# EAGLE design IR_FORWARD_V1 (EAGLE 9.6.2)
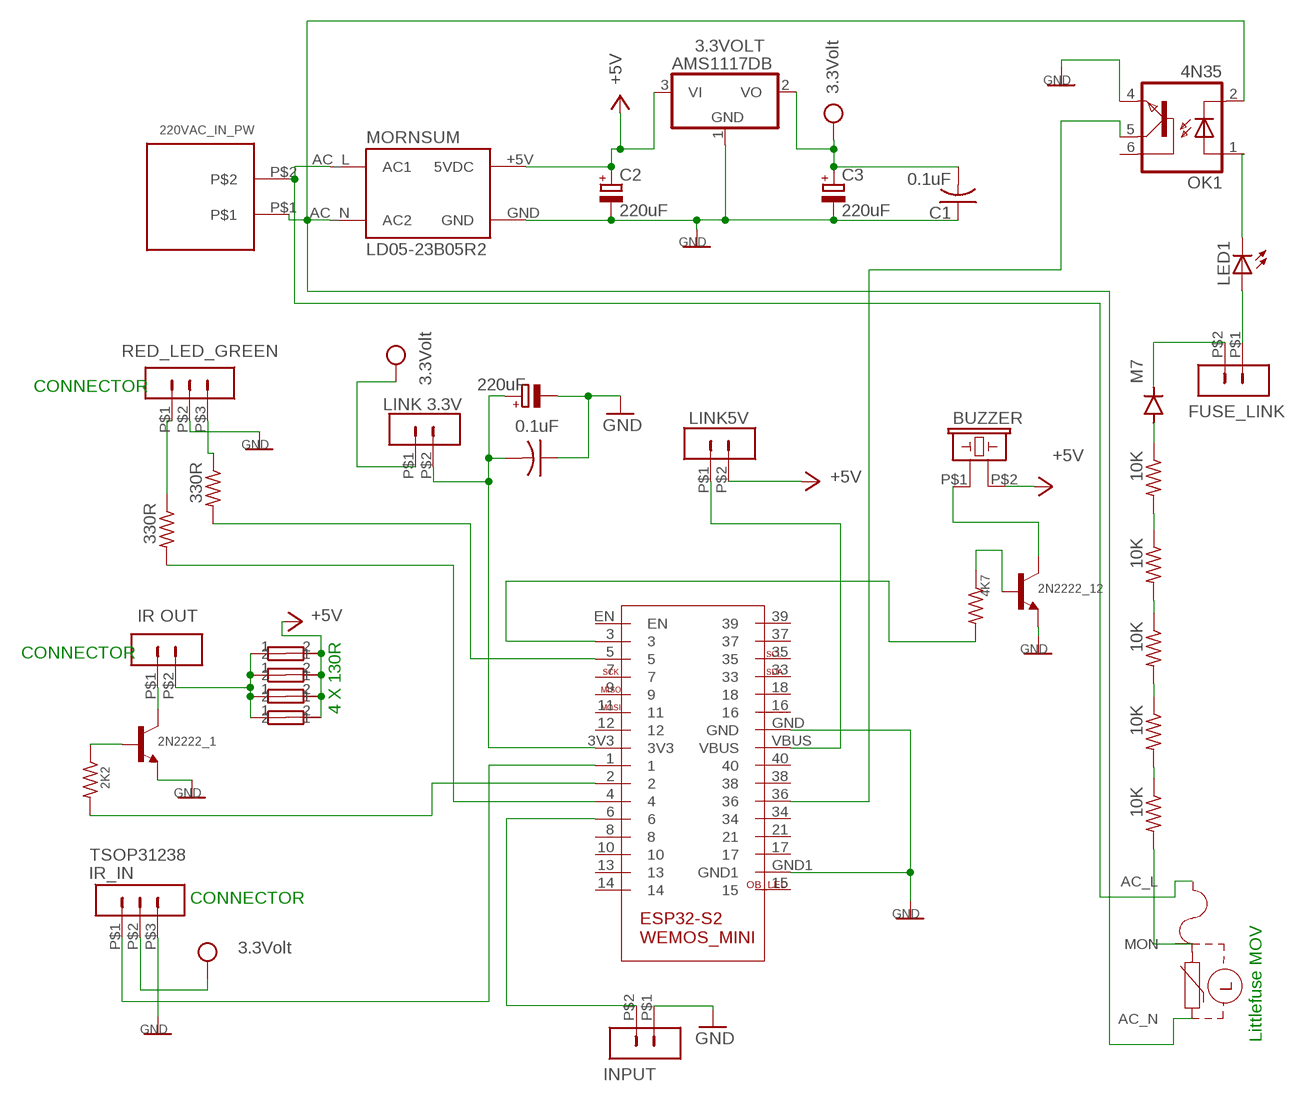
[diagram p0: schematic, sheet 1]

## Parts
2N2222_1  2N2222  2N3904  [TO92]
2N2222_12  2N2222  2N3904  [TO92]
3.3VOLT  AMS1117DB  [SOT223]
220VAC_SWITCH1  220VAC_IN_PW  TERMINAL-5.08MM-2DOUBLESIDE  [TERM-5.05-2]
BUZZER  BUZZERDONUT  [F/CM12P_2]
C1  0.1uF  C-US050-025X075  [C050-025X075]
C2  220uF  CPOL-EUE2.5-7  [E2,5-7]
C3  220uF  CPOL-EUE2.5-7  [E2,5-7]
C5  0.1uF  C-US050-025X075  [C050-025X075]
C6  220uF  CPOL-EUE2.5-7  [E2,5-7]
IR_IN  TSOP31238  3WAYHEADERSTRIPNARROW  [3WAY_SH_NARROW]
LED1  LEDCHIPLED_0805  [CHIPLED_0805]
LINK5V  LINK5V  2WAYHEADERSTRIP2WAYHP  [2WAYNORMAL]
M7-10  M7  DIODE-SOD106-R  [SOD106-R]
MORNSUM  MORNSUM_PSLONG  [LD05-23B05R2-M]
OK1  4N35  [DIL06]
R1  2K2  R-US_R0805  [R0805]
R2  330R  R-US_R0805  [R0805]
R5  330R  R-US_R0805  [R0805]
R10  10K  R-US_R1206  [R1206]
R11  10K  R-US_R1206  [R1206]
R12  10K  R-US_R1206  [R1206]
R13  10K  R-US_R1206  [R1206]
R14  10K  R-US_R1206  [R1206]
R48  4K7  R-US_R0805  [R0805]
U$1  RED_LED_GREEN  3WAYHEADERSTRIPNARROW  [3WAY_SH_NARROW]
U$2  130R  RESISTOR  [0207/10]
U$3  130R  RESISTOR  [0207/10]
U$4  WEMOS_S2_MINI  [WEMOS_S2_MINI]
U$5  130R  RESISTOR  [0207/10]
U$6  INPUT  2WAYHEADERSTRIPNARROW  [2WAY_SH_NARROW]
U$7  130R  RESISTOR  [0207/10]
U$9  LITLE_FUSE  [LITLE_FUSE]
U$12  IR OUT  2WAYHEADERSTRIPNARROW  [2WAY_SH_NARROW]
U$15  LINK 3.3V  2WAYHEADERSTRIP2WAYHP  [2WAYNORMAL]
U$20  FUSE_LINK  2WAYHEADERSTRIP2WAYHP  [2WAYNORMAL]

## Nets
+5V [12V]: 3.3VOLT.3(VI) BUZZER.P$2 C2.+ LINK5V.P$2 MORNSUM.+5V(5VDC) U$2.2 U$3.2 U$5.2 U$7.2
GND [GND]: 2N2222_1.3(E) 2N2222_12.3(E) 3.3VOLT.1(GND) C1.1 C2.- C3.- C5.1 C6.- IR_IN.P$3 MORNSUM.GND OK1.4(EMI) U$1.P$2 U$4.GND U$4.GND1 U$6.P$1
N$1 [POWER]: LINK5V.P$1 U$4.VBUS
N$2: 2N2222_12.2(B) R48.1
N$3 [POWER]: U$2.1 U$3.1 U$5.1 U$7.1 U$12.P$2
N$4: R2.1 U$1.P$3
N$5: R2.2 U$4.5
N$7 [POWER]: 220VAC_SWITCH1.P$1 MORNSUM.AC_N(AC2) OK1.2(C) U$9.AC_N
N$8: R5.1 U$1.P$1
N$9 [POWER]: 220VAC_SWITCH1.P$2 MORNSUM.AC_L(AC1) U$9.AC_L
N$10: R11.2 R12.1
N$12: R5.2 U$4.4
N$27: U$4.6 U$6.P$2
N$32: 2N2222_1.2(B) R1.1
N$34 [3V]: C5.2 C6.+ U$4.3V3 U$15.P$2
N$36: R1.2 U$4.2
N$37 [POWER]: 2N2222_1.1(C) U$12.P$1
N$38: 2N2222_12.1(C) BUZZER.P$1
N$41: IR_IN.P$1 U$4.1
N$42: OK1.5(COL) U$4.36
N$43: LED1.C OK1.1(A)
N$52: R10.1 R14.2
N$53: R10.2 R11.1
N$54: R48.2 U$4.3
N$55: R12.2 R13.1
N$56: LED1.A U$20.P$1
N$57: M7-10.A R14.1
N$58: M7-10.C U$20.P$2
N$61: R13.2 U$9.MON
VCC [3V]: 3.3VOLT.2(VO) C1.2 C3.+ IR_IN.P$2 U$15.P$1
Unconnected: OK1.6(BAS) U$4.7 U$4.8 U$4.9 U$4.10 U$4.11 U$4.12 U$4.13 U$4.14 U$4.15 U$4.16 U$4.17 U$4.18 U$4.21 U$4.33 U$4.34 U$4.35 U$4.37 U$4.38 U$4.39 U$4.40 U$4.EN

## Notes on the sheet
- CONNECTOR
- CONNECTOR
- 4 X 130R
- CONNECTOR
- Littlefuse MOV

## Library data of the parts
2N2222_1 2N2222_12 = transistor:2N3904: NPN TRANSISTOR
3.3VOLT = BDV_01:AMS1117: 250 mA, 16V, Low Quiescent Current LDO Regulator Source: http://ww1.microchip.com/downloads/en/DeviceDoc/22049b.pdf
220VAC_SWITCH1 = BDV_01:TERMINAL-5.08MM-2: Terminal 5.08mm - 2
BUZZER = BDV_01:BUZZER
C1 C5 = adafruit:C-US: CAPACITOR, American symbol
C2 C3 C6 = resistor:CPOL-EU: POLARIZED CAPACITOR, European symbol
IR_IN U$1 = BDV_02:3WAYHEADERSTRIP: 3Way Connect
LED1 = adafruit:LED: LED OSRAM: - CHIPLED LG R971, LG N971, LY N971, LG Q971, LY Q971, LO R971, LY R971 LH N974, LH R974 LS Q976, LO Q976, LY Q976 LO Q996 - Hyper CHIPLED LW Q18S LB Q993, LB Q99A, LB R99A - SideLED LS A670, LO A670, LY A670, LG A670, LP A670 LB A673, LV A673, LT A673, LW A673 LH A674 LY A675 LS A676, LA A676, LO A676, LY A676, LW A676 LS A679, LY A679, LG A679 - Hyper Micro SIDELED® LS Y876, LA Y876, LO Y876, LY Y876 LT Y87S - SmartLED LW L88C, LW L88S LB L89C, LB L89S, LG L890 LS L89K, LO L89K, LY L89K LS L896, LA L896, LO L896, LY L896 - TOPLED LS T670, LO T670, LY T670, LG T670, LP T670 LSG T670, LSP T670, LSY T670, LOP T670, LYG T670 LG T671, LOG T671, LSG T671 LB T673, LV T673, LT T673, LW T673 LH T674 LS T676, LA T676, LO T676, LY T676, LB T676, LH T676, LSB T676, LW T676 LB T67C, LV T67C, LT T67C, LS T67K, LO T67K, LY T67K, LW E67C LS E67B, LA E67B, LO E67B, LY E67B, LB E67C, LV E67C, LT E67C LW T67C LS T679, LY T679, LG T679 LS T770, LO T770, LY T770, LG T770, LP T770 LB T773, LV T773, LT T773, LW T773 LH T774 LS E675, LA E675, LY E675, LS T675 LS T776, LA T776, LO T776, LY T776, LB T776 LHGB T686 LT T68C, LB T68C - Hyper Mini TOPLED® LB M676 - Mini TOPLED Santana® LG M470 LS M47K, LO M47K, LY M47K Source: http://www.osram.convergy.de/
LINK5V U$6 U$12 U$15 U$20 = BDV_02:2WAYHEADERSTRIP: Narrow
M7-10 = diode:DIODE-: DIODE
MORNSUM = BDV_02:MORNSUM_PS: Mornsum LD05-23B05R2
OK1 = BDV_02:4N35: MOTOROLA OPTO COUPLER; MF: FAIRCHILD SEMICONDUCTOR; MPN: 4N35; OC_FARNELL: 1328375; OC_NEWARK: 72K9946
R1 R2 R5 R48 = resistor:R-US_: RESISTOR, American symbol
R10-R14 = adafruit:R-US_: RESISTOR, American symbol
U$2 U$3 U$5 U$7 = BDV_02:RESISTOR
U$4 = BDV_02:WEMOS_S2_MINI: WEMOS_MINI
U$9 = BDV_02:LITLE_FUSE: Litle Fuse

## Net classes
0 default: width 0.5 mm, drill 0.305 mm, clearance 0.305 mm
1 POWER: width 1.2 mm, drill 0.305 mm, clearance 0.305 mm to class 0, clearance 0.305 mm
2 12V: width 1 mm, drill 0.305 mm, clearance 0.305 mm to class 0, clearance 0.305 mm to class 1, clearance 0.305 mm
3 ground: width 1 mm, drill 0.305 mm, clearance 0.305 mm to class 0, clearance 0.305 mm to class 1, clearance 0.305 mm to class 2, clearance 0.305 mm
4 3V: width 1 mm, drill 0.305 mm, clearance 0.305 mm to class 0, clearance 0.305 mm to class 1, clearance 0.305 mm to class 2, clearance 0.305 mm to class 3, clearance 0.305 mm
5 GND: width 1 mm, drill 0.305 mm, clearance 0.305 mm to class 0, clearance 0.305 mm to class 1, clearance 0.305 mm to class 2, clearance 0.305 mm to class 3, clearance 0.305 mm to class 4, clearance 0.305 mm
6 12mil: width 0.305 mm

## Board
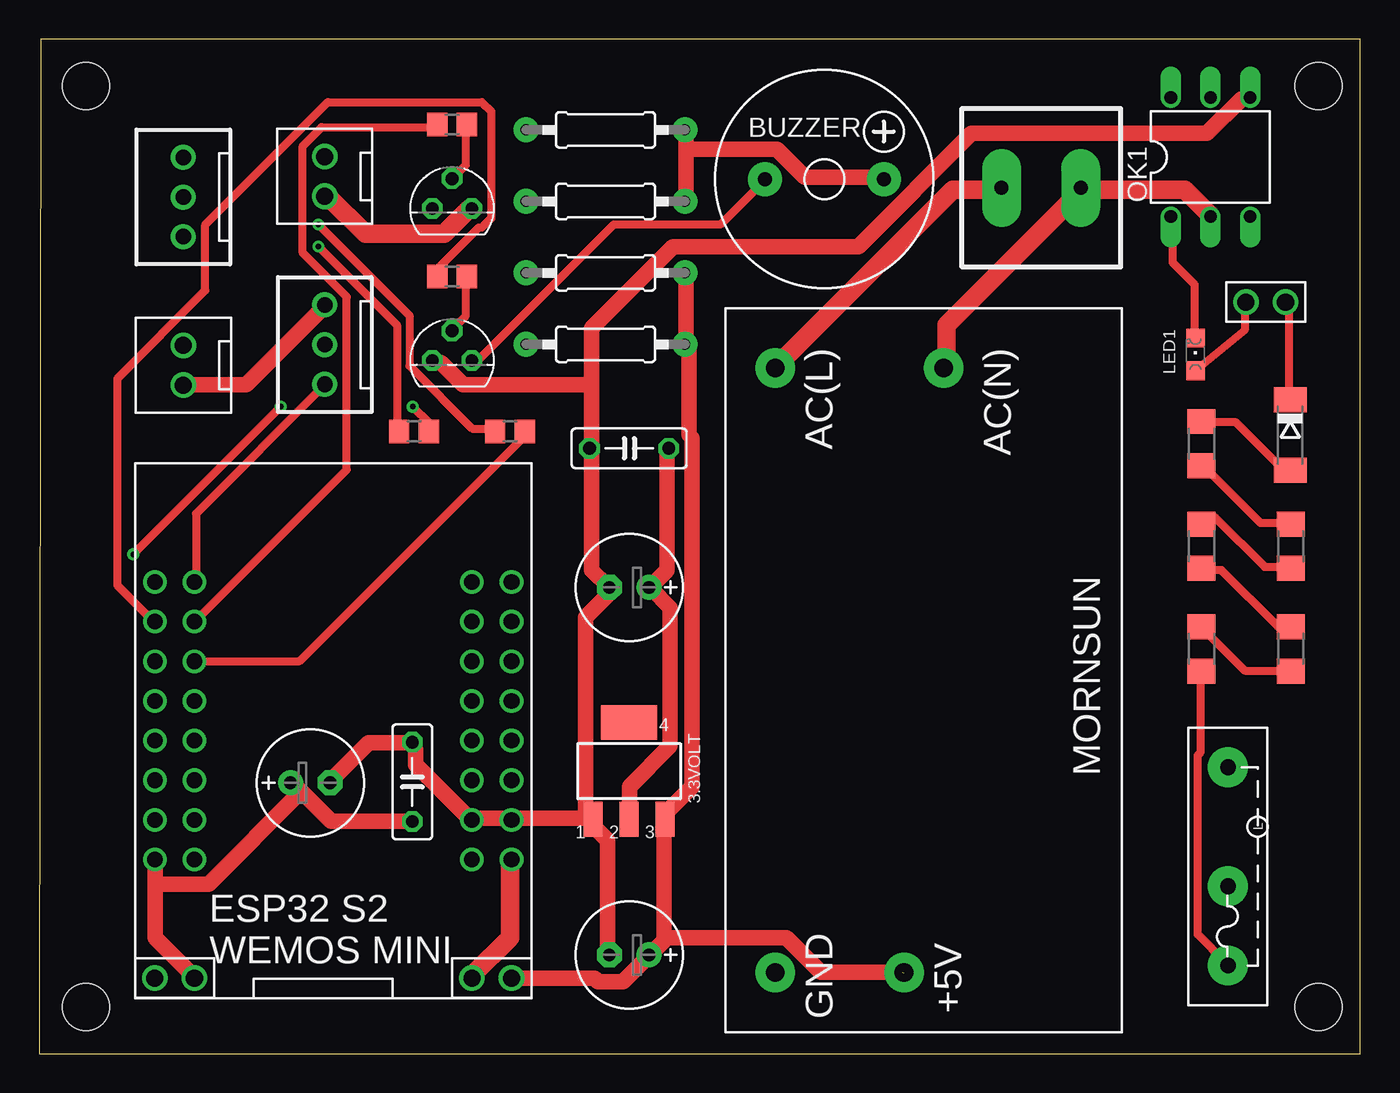
[diagram p1: board, top side]
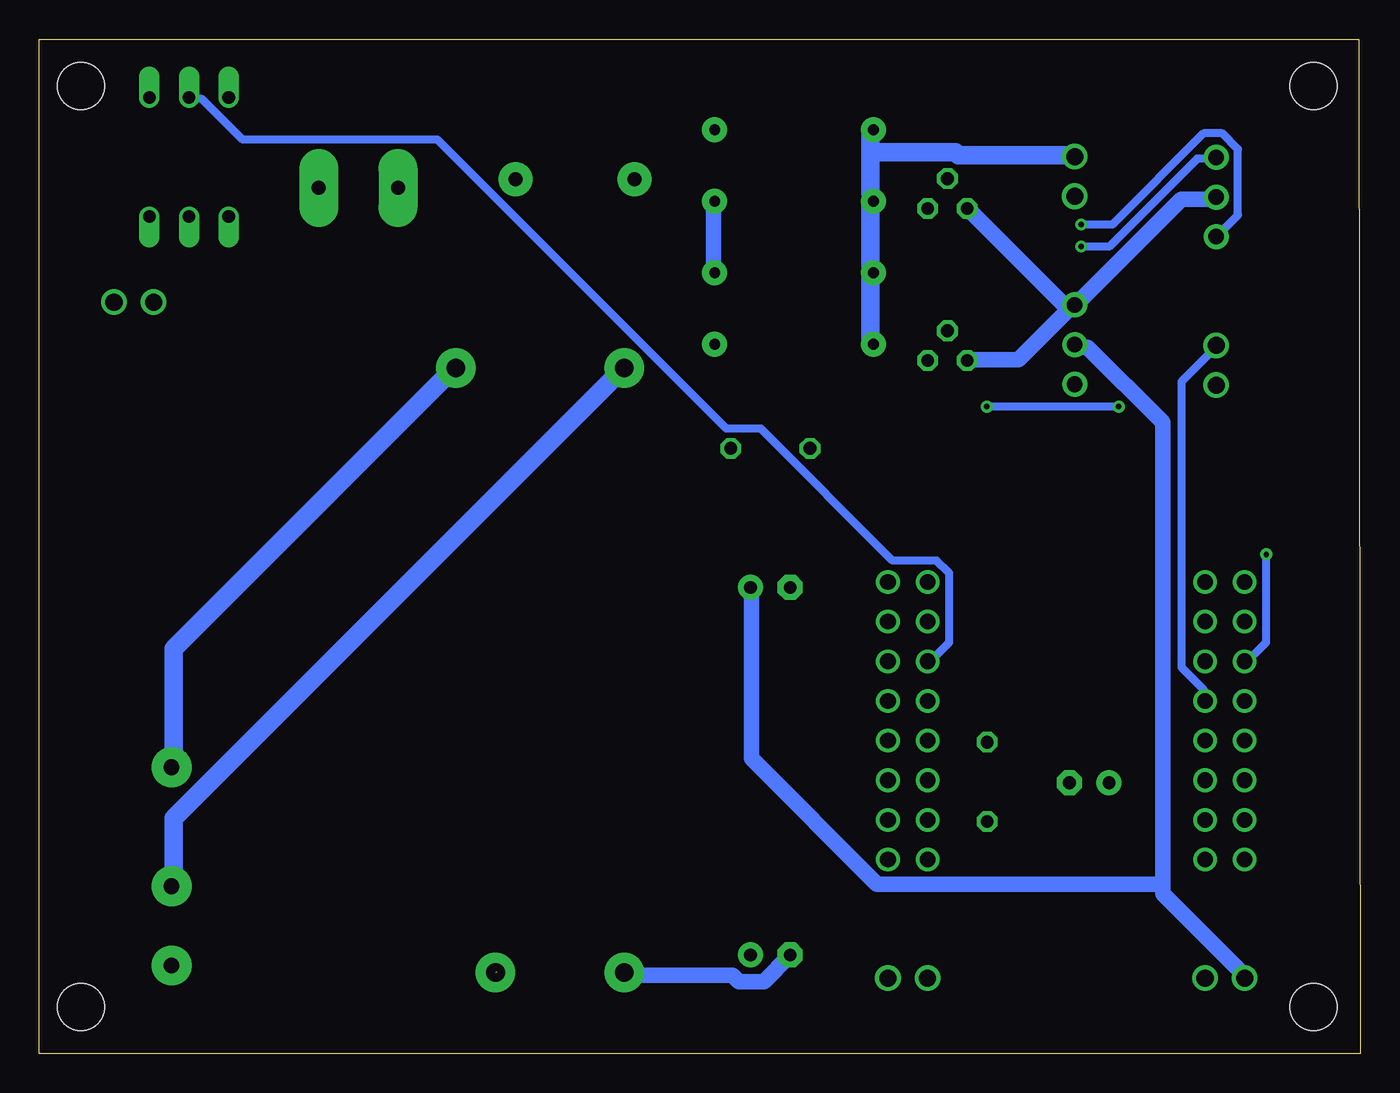
[diagram p2: board, bottom side, seen from below]

Size 84.68 x 65 mm. Coordinates in mm from the lower left corner, seen from the top.
Outline: 0,0 84.68,0 84.68,65 0.1,65 0,0
Copper layers (1*16): Top 0.035mm / dielectric 1.5mm / Bottom 0.035mm
Design rules "default *": minimum track width 6mil, minimum drill 0.35mm, track to track 6mil, track to pad 6mil, pad to pad 6mil, via to via 6mil, smd to smd 6mil, copper to edge 40mil, drill to drill 6mil, minimum pad ring 10mil, minimum via ring 8mil, stop-mask expansion 4mil, vias tented up to drill 20mil, thermal gap 10mil
Holes 3 mm at 3,62 3,3 82,3 82,62

### Footprints (pad centres in the part's own frame; a part is rotated, then mirrored left to right if it is on the bottom)
TO92 = drill 0.813 octagon: 1 1.27,0; 2 0,1.905; 3 -1.27,0
SOT223 = smd 1.219 x 2.235: 1 -2.311,-3.099; 2 0,-3.099; 3 2.311,-3.099 | smd 3.6 x 2.2: 4 0,3.099
TERM-5.05-2 = drill 0.9 pad 2.5 long: P$1 0,2.54; P$2 0,-2.54
F/CM12P_2 = drill 0.9 pad 2.184: P$1 -3.81,0; P$2 3.81,0
C050-025X075 = drill 0.813 octagon: 1 -2.54,0; 2 2.54,0
E2,5-7 = drill 0.813 pad 1.6: + -1.27,0 | drill 0.813 pad 1.6 octagon: - 1.27,0
3WAY_SH_NARROW = drill 1 pad 1.6: P$1 -6.35,0; P$2 -3.81,0; P$3 -1.27,0
CHIPLED_0805 = smd 1.2 x 1.2: A 0,-1.05; C 0,1.05
2WAYNORMAL = drill 1.092: P$1 -1.27,0; P$2 1.27,0
SOD106-R = smd 1.6 x 2.1: A 2.25,0; C -2.25,0
LD05-23B05R2-M = drill 1.2 pad 2.54: +5V 19.05,0; AC_L -19.685,-8.255; AC_N -19.685,2.54; GND 19.05,-8.255
DIL06 = drill 0.813 offset: 1 -2.54,-3.81; 2 0,-3.81; 3 2.54,-3.81; 4 2.54,3.81; 5 0,3.81; 6 -2.54,3.81
R0805 = smd 1.3 x 1.5: 1 -0.95,0; 2 0.95,0
R1206 = smd 1.6 x 1.803: 1 -1.422,0; 2 1.422,0
0207/10 = drill 0.7 pad 1.6: 1 -5.08,0; 2 5.08,0
WEMOS_S2_MINI = drill 1: 1 -8.89,10.16; 2 -8.89,7.62; 3 -11.43,7.62; 3V3 -11.43,-7.62; 4 -8.89,5.08; 5 -11.43,5.08; 6 -8.89,2.54; 7 -11.43,2.54; 8 -8.89,0; 9 -11.43,0; 10 -8.89,-2.54; 11 -11.43,-2.54; 12 -11.43,-5.08; 13 -8.89,-5.08; 14 -8.89,-7.62; 15 8.89,-7.62; 16 11.43,-2.54; 17 8.89,-2.54; 18 11.43,0; 21 8.89,0; 33 11.43,2.54; 34 8.89,2.54; 35 11.43,5.08; 36 8.89,5.08; 37 11.43,7.62; 38 8.89,7.62; 39 11.43,10.16; 40 8.89,10.16; EN -11.43,10.16; GND 11.43,-5.08; GND1 8.89,-5.08; VBUS 11.43,-7.62
2WAY_SH_NARROW = drill 1.092: P$1 -1.27,0; P$2 1.27,0
LITLE_FUSE = drill 1 pad 2.54: AC_L -1.27,0; AC_N 6.35,0; MON -6.35,0

### Placement (x,y rotation side)
2N2222_1  26.47,54.15 0 top
2N2222_12  26.47,44.4 0 top
3.3VOLT  37.81,18.11 0 top
220VAC_SWITCH1  64.22,55.47 270 top
BUZZER  50.33,56.02 0 top
C1  37.81,38.78 0 top
C2  37.81,6.33 180 top
C3  37.81,29.87 180 top
C5  23.92,17.42 270 top
C6  17.38,17.35 0 top
IR_IN  18.31,49.23 90 top
LED1  74.11,44.8 0 top
LINK5V  29.01,4.85 0 top
M7-10  80.17,39.63 270 top
MORNSUM  55.43,24.25 270 top
OK1  75.07,57.44 0 top
R1  26.47,59.53 180 top
R2  24.03,39.87 0 top
R5  30.18,39.87 0 top
R10  80.22,32.51 270 top
R11  74.49,32.51 270 top
R12  80.22,25.94 270 top
R13  74.49,25.94 270 top
R14  74.49,39.08 270 top
R48  26.47,49.78 180 top
U$1  9.25,58.69 90 top
U$2  36.3,59.18 0 top
U$3  36.3,54.6 0 top
U$4  18.85,20.06 0 top
U$5  36.3,50.02 0 top
U$6  9.25,44.1 90 top
U$7  36.3,45.44 0 top
U$9  76.18,12 90 top
U$12  18.31,56.2 90 top
U$15  8.69,4.85 0 top
U$20  78.61,48.15 0 top

### Tracks (layer width: path | path; a pad name or v marks a point on that pad's centre or on a via)
+5V  (1 unrouted)
  Top 1: U$5.2 41.45,49.9 41.45,45.47 U$7.2 41.65,45.07 41.65,39.64 41.85,39.44 41.85,17.1 40.24,15.49 3.3VOLT.3 40.04,14.89 40.04,7.44 | 41.45,57.95 41.45,59.15 U$2.2 | 41.45,57.95 41.45,54.73 U$3.2 | 41.45,57.95 47.28,57.95 49.09,56.13 54.12,56.13 BUZZER.P$2 | 40.04,7.44 40.04,7.24 39.23,6.44 C2.+ 38.83,6.04 37.42,4.63 35.81,4.63 35.61,4.83 30.38,4.83 LINK5V.P$2 | 55.33,5.23 50.1,5.23 47.89,7.44 40.04,7.44
  Bottom 1: U$5.2 41.45,50.1 41.45,54.52 U$3.2
GND
  Top 1: C6.- 18.71,17.5 21.13,19.92 23.74,19.92 C5.1 24.14,19.52 24.14,18.51 27.36,15.29 U$4.GND1 27.77,15.09 29.78,15.09 U$4.GND 30.38,15.09 35.41,15.09 3.3VOLT.1 | C2.- 36.42,6.44 36.42,13.68 35.41,14.69 3.3VOLT.1 | U$6.P$1 9.26,42.86 13.28,42.86 18.31,47.89 IR_IN.P$3 | 35.41,42.86 35.41,39.23 C1.1 35.41,38.63 35.41,30.98 36.42,29.98 C3.- 36.42,29.38 35.01,27.97 35.01,15.49 3.3VOLT.1 | 35.41,42.86 35.41,46.48 40.64,51.71 52.51,51.71 59.76,58.95 74.85,58.95 77.06,61.16 77.46,61.16 OK1.4 | 35.41,42.86 27.16,42.86 25.75,44.26 25.35,44.26 2N2222_12.3
  Bottom 1: MORNSUM.GND 47.08,5.03 40.24,5.03 39.84,4.63 38.23,4.63 36.62,6.24 C2.- | 2N2222_12.3 25.15,44.47 21.93,44.47 18.51,47.89 IR_IN.P$3 | 2N2222_1.3 25.15,54.12 18.91,47.89 IR_IN.P$3 | U$1.P$2 9.26,54.73 11.47,54.73 17.91,48.29 IR_IN.P$3
N$1
  Top 1.2: U$4.VBUS 30.18,12.27 30.18,7.44 27.77,5.03 LINK5V.P$1
N$2
  Top 0.5: R48.1 27.36,49.7 27.36,47.28 26.56,46.48 2N2222_12.2
N$3
  Bottom 1.2: U$7.1 31.39,45.47 31.39,49.9 U$5.1 31.39,50.5 31.39,54.52 U$3.1 31.39,55.13 31.39,57.74 | 31.39,57.74 31.39,59.15 U$2.1 | 31.39,57.74 25.95,57.74 25.75,57.54 18.51,57.54 U$12.P$2
N$4  (via drill 0.35)
  Top 0.5: v17.91,51.71 22.94,46.68 22.94,40.04 R2.1
  Bottom 0.5: v17.91,51.71 16.1,51.71 10.46,57.34 9.26,57.34 U$1.P$3
N$5  (via drill 0.35)
  Top 0.5: v23.94,41.45 24.95,40.44 24.95,40.04 R2.2 | v6.04,31.99 v15.49,41.45
  Bottom 0.5: v15.49,41.45 v23.94,41.45 | v6.04,31.99 6.04,26.36 7.24,25.15 U$4.5
N$7
  Top 1.2: OK1.2 75.05,53.72 73.44,55.33 66.8,55.33 220VAC_SWITCH1.P$1 66.4,54.93 58.15,46.68 58.15,44.06 MORNSUM.AC_N
  Bottom 1.2: U$9.AC_N 76.05,18.51 76.05,25.95 58.15,43.86 MORNSUM.AC_N
N$8  (via drill 0.35)
  Top 0.5: v17.91,53.12 23.74,47.28 23.74,44.06 27.77,40.04 29.17,40.04 R5.1
  Bottom 0.5: v17.91,53.12 15.89,53.12 10.06,58.95 8.85,58.95 7.85,57.95 7.85,53.72 9.05,52.51 U$1.P$1
N$9
  Top 1.2: 220VAC_SWITCH1.P$2 61.57,55.33 58.55,55.33 47.28,44.06 MORNSUM.AC_L
  Bottom 1.2: U$9.AC_L 76.05,10.87 76.05,15.09 47.28,43.86 MORNSUM.AC_L
N$10
  Top 0.5: R11.2 74.64,30.98 75.77,30.98 79.37,27.38 R12.1
N$12
  Top 0.5: R5.2 30.98,39.84 30.98,39.44 16.7,25.15 10.06,25.15 U$4.4
N$27
  Bottom 0.5: U$4.6 10.06,22.74 10.06,23.34 11.47,24.75 11.47,43.06 9.26,45.27 U$6.P$2
N$32
  Top 0.5: R1.1 27.36,59.35 27.36,56.94 26.56,56.13 2N2222_1.2
N$34
  Top 1: 16.8,16.8 16.3,17.3 C6.+ | 16.8,16.8 18.71,14.89 23.74,14.89 C5.2 | 7.44,10.87 7.44,7.44 9.86,5.03 U$15.P$2 | 7.44,10.87 7.44,12.27 U$4.3V3 | 16.8,16.8 10.87,10.87 7.44,10.87
N$36
  Top 0.5: R1.2 25.35,59.35 18.11,59.35 16.9,58.15 16.9,51.31 19.72,48.49 19.72,37.42 10.06,27.77 U$4.2
N$37
  Top 1.2: 2N2222_1.1 27.56,54.12 25.95,52.51 20.93,52.51 18.51,54.93 U$12.P$1
N$38
  Top 0.5: 2N2222_12.1 27.77,44.47 28.17,44.47 36.82,53.12 43.66,53.12 46.48,55.93 BUZZER.P$1
N$41
  Top 0.5: U$4.1 10.06,30.38 10.06,34.61 18.31,42.86 IR_IN.P$1
N$42
  Bottom 0.5: OK1.5 75.05,61.16 74.24,61.16 71.63,58.55 59.15,58.55 40.64,40.04 38.43,40.04 29.98,31.59 27.16,31.59 26.36,30.78 26.36,26.36 27.56,25.15 U$4.36
N$43
  Top 0.5: LED1.C 74.04,45.87 74.04,49.28 72.63,50.69 72.63,53.52 OK1.1
N$52
  Top 0.5: R10.1 80.08,34 78.27,34 74.64,37.62 R14.2
N$53
  Top 0.5: R10.2 80.08,31.19 78.54,31.19 75.38,34.35 R11.1
N$54
  Top 0.5: R48.2 25.55,49.9 25.55,50.3 28.17,52.92 28.37,52.92 28.97,53.52 28.97,60.36 28.37,60.96 18.51,60.96 10.66,53.12 10.66,48.89 5.03,43.26 5.03,29.98 7.24,27.77 U$4.3
N$55
  Top 0.5: R12.2 80.08,24.55 77.26,24.55 74.64,27.16 R13.1
N$56
  Top 0.5: LED1.A 77.26,46.35 77.26,48.09 U$20.P$1
N$57
  Top 0.5: R14.1 74.64,40.44 76.7,40.44 79.43,37.72 M7-10.A
N$58
  Top 0.5: M7-10.C 80.08,42.05 80.08,48.09 U$20.P$2
N$61
  Top 0.5: R13.2 74.44,24.34 74.44,19.32 74.24,19.11 74.24,7.65 76.05,5.83 U$9.MON
VCC
  Top 1: 3.3VOLT.2 37.83,15.09 37.83,17.1 40.44,19.72 40.44,28.57 39.23,29.78 C3.+ 39.44,30.18 40.24,30.98 40.24,38.63 C1.2
  Bottom 1: 12.68,10.87 12.68,10.26 7.44,5.03 U$15.P$1 | 12.68,10.87 12.68,40.44 17.5,45.27 18.31,45.27 IR_IN.P$2 | 12.68,10.87 30.98,10.87 39.03,18.91 39.03,29.78 C3.+

### Text on the board
tValues: + | + | + | + | WEMOS ESP32-S2 MINI IR FORWARD - 30/10/2026